# Altium schematic sheet PWR RAIL.SchDoc: ESP32 - ANALOG BOARD
size A3; DrawnBy: Luca Schenetti; Engineer: Luca Schenetti; Revision: B; SheetNumber: 6; SheetTotal: 5
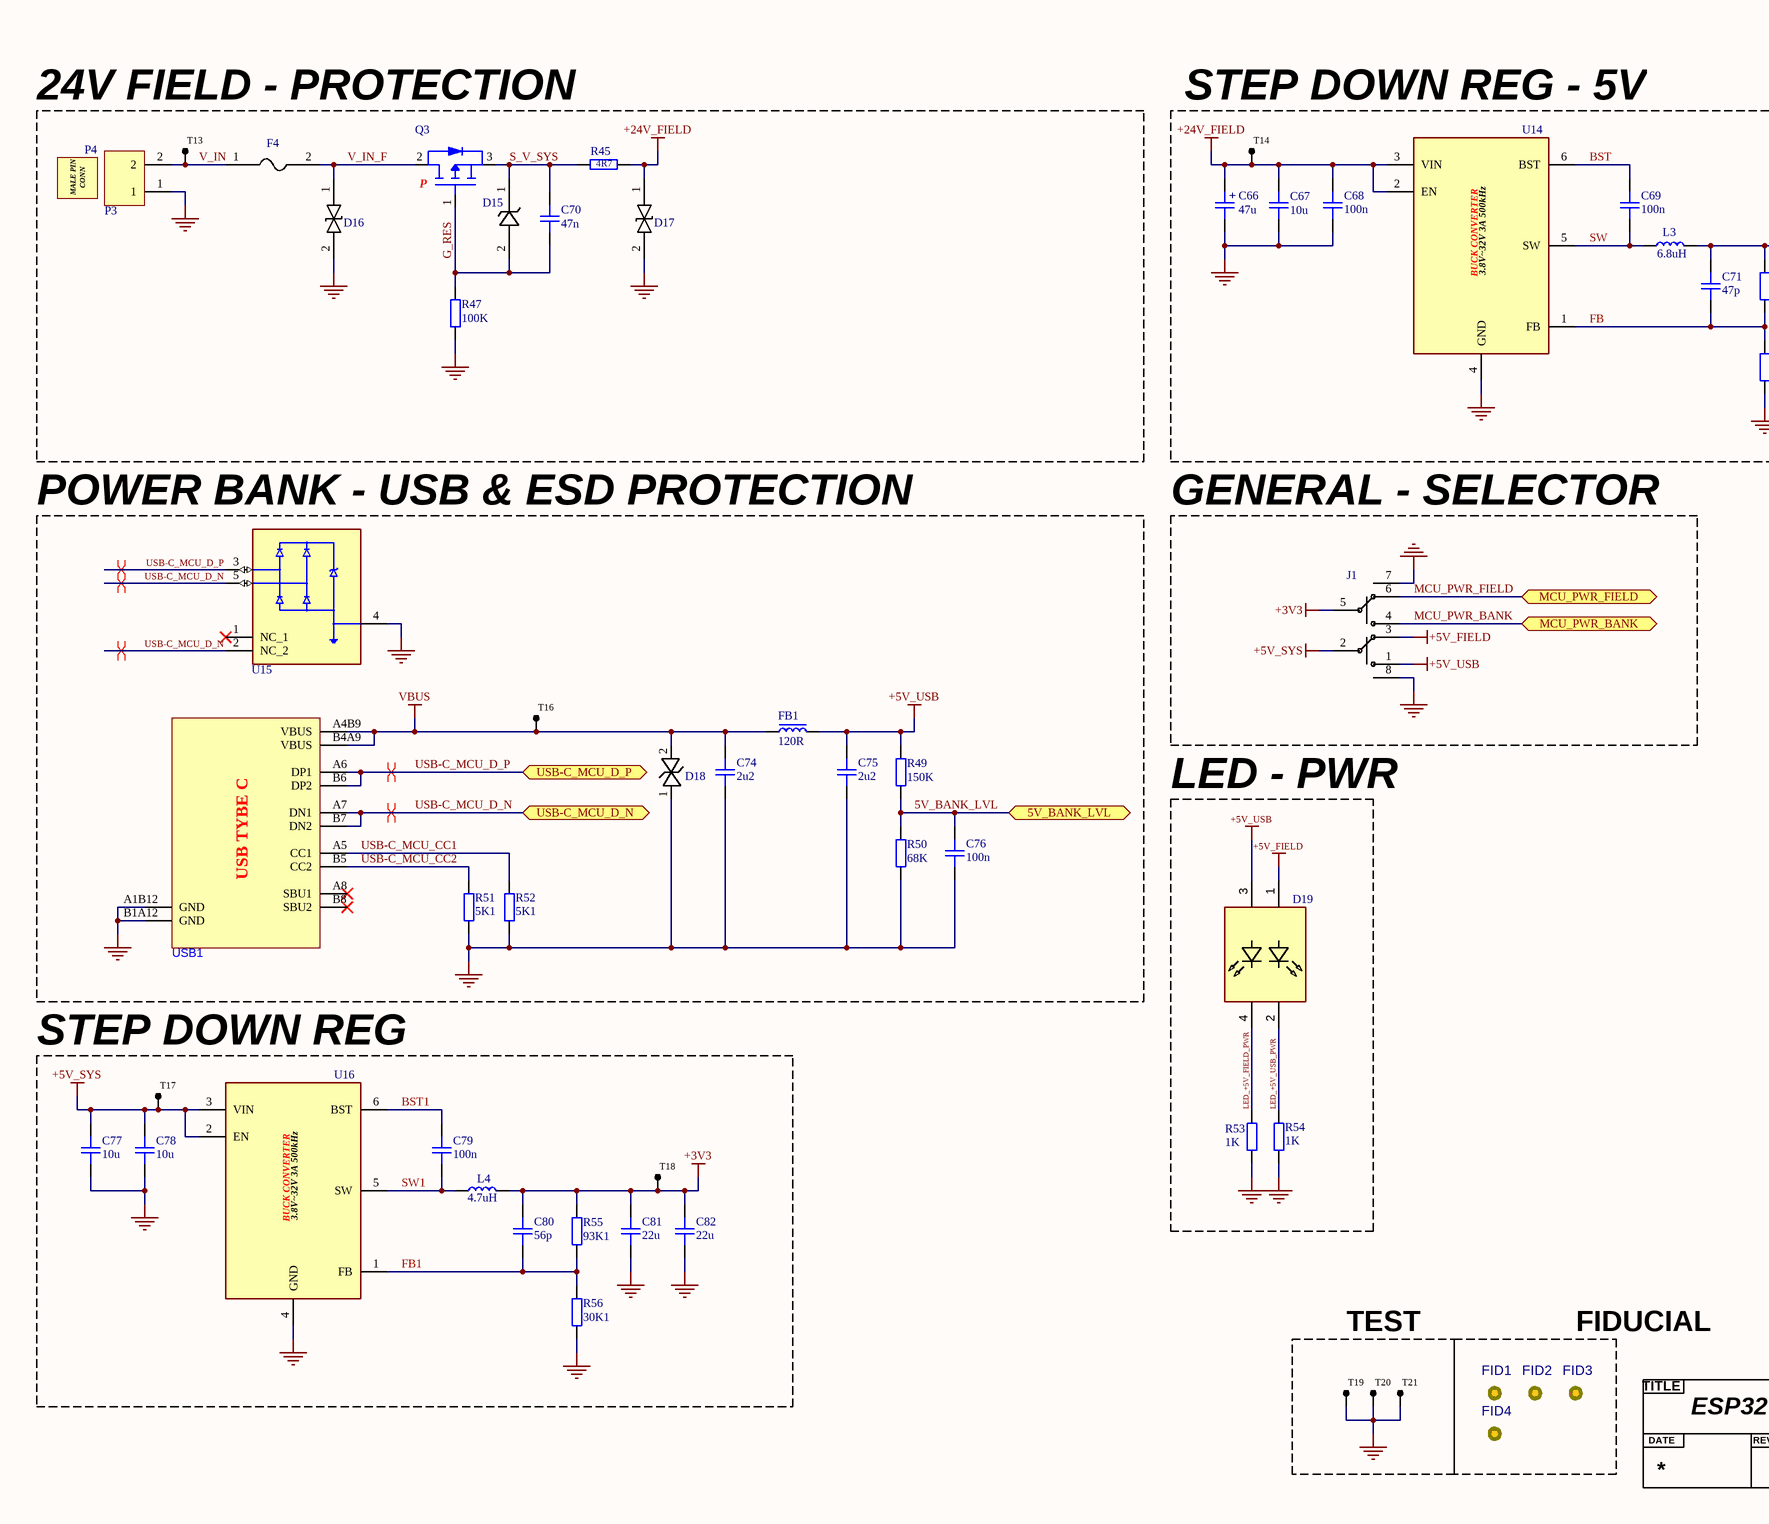
[diagram p0: PWR RAIL.SchDoc, left]
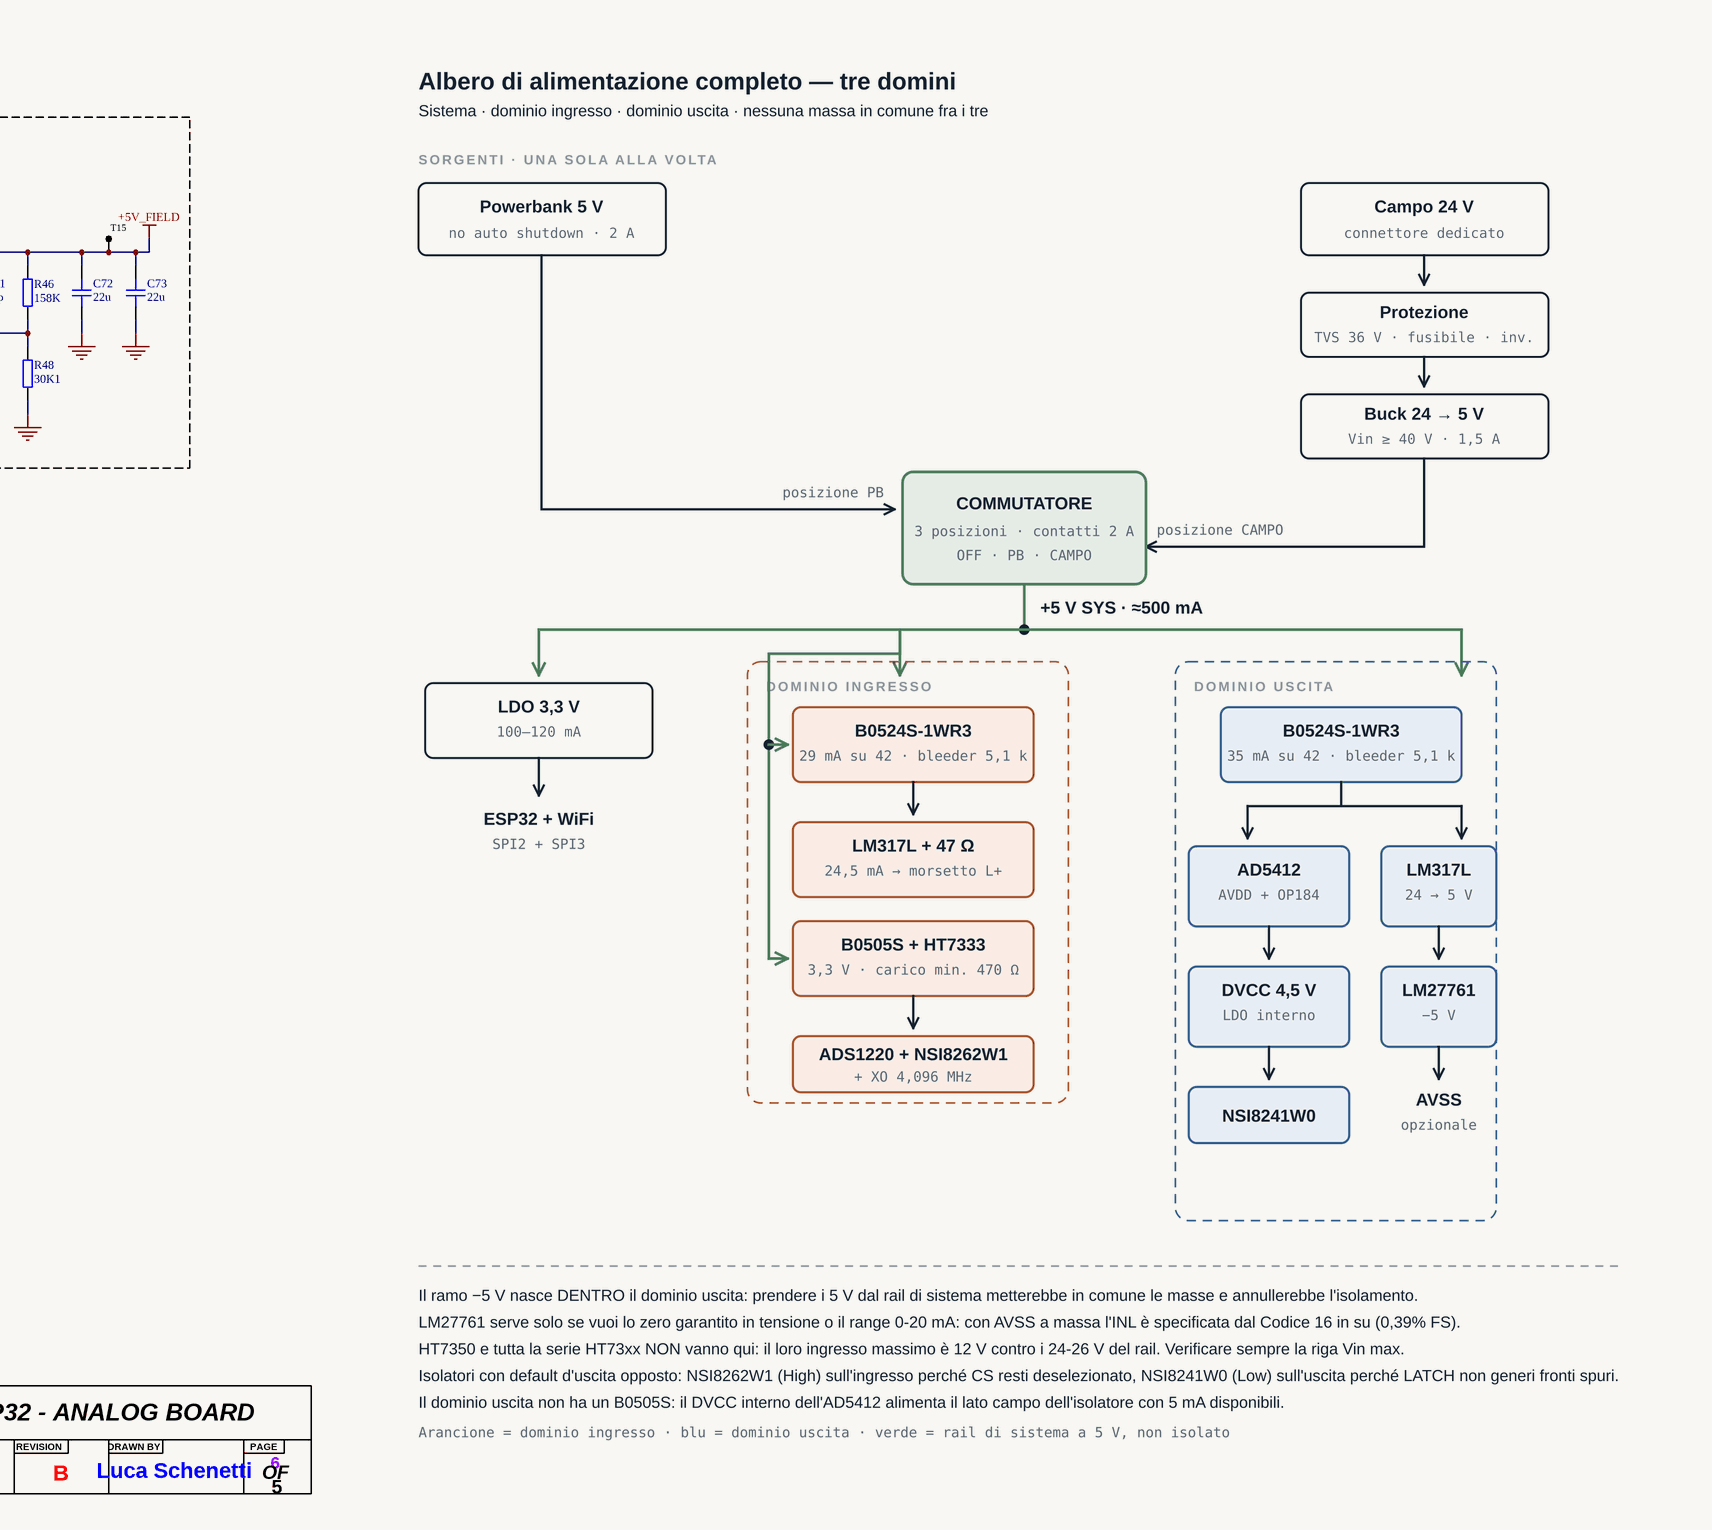
[diagram p1: PWR RAIL.SchDoc, right]

## Parts
?  Title  (value not drawn)  (graphical)
C66  47u  [CAP_ALEL_6.3x5.4]
C67  10u  [CAP_0805]
C68  100n  [CAP_0603]
C69  100n  [CAP_0603]
C70  47n  [CAP_0603]
C71  47p  [CAP_0603]
C72  22u  [CAP_0603]
C73  22u  [CAP_0603]
C74  2u2  [CAP_0402]
C75  2u2  [CAP_0402]
C76  100n  [CAP_0402]
C77  10u  [CAP_0603]
C78  10u  [CAP_0603]
C79  100n  [CAP_0603]
C80  56p  [CAP_0603]
C81  22u  [CAP_0603]
C82  22u  [CAP_0603]
D15  ZENER DIODE 15V  [BZT52C15]  (value not drawn)
D16  BIDI TVS 30V  [SMAJ30CA]  (value not drawn)
D17  BIDI TVS 30V  [SMAJ30CA]  (value not drawn)
D18  ESD Protection TVS 6.0V  [SMF6.0CA]  (value not drawn)
D19  TWO LED GREEN  [TJ-L3F2LTQYKMQFLC7K-A5]  (value not drawn)
F4  PTC 60V 500mA  [mSMD050-60V]  (value not drawn)
FB1  120R  [FB_0402]
FID1  FIDUCIAL  [FIDUCIAL]  (value not drawn)  (no BOM)
FID2  FIDUCIAL  [FIDUCIAL]  (value not drawn)  (no BOM)
FID3  FIDUCIAL  [FIDUCIAL]  (value not drawn)  (no BOM)
FID4  FIDUCIAL  [FIDUCIAL]  (value not drawn)  (no BOM)
J1  DPDT  [2MD3T2B1M6RES]  (value not drawn)
L3  6.8uH  [FXL0530-6R8-M]
L4  4.7uH  [IND-SMD_L4.4-W4.2]
P3  2P PLUGGABLE TERMINAL BLOCK 3.81MM  [WJ15EDGRC-3.81-2P]  (value not drawn)
P4  MALE CONN 2P 3.81mm  [WJ15EDGK-3.81-2P]  (value not drawn)
Q3  P-Mosfet 60V 3A  [BSP315P]  (value not drawn)
R45  4R7  [RES_2512]
R46  158K  [RES_0603]
R47  100K  [RES_0603]
R48  30K1  [RES_0603]
R49  150K  [RES_0402]
R50  68K  [RES_0402]
R51  5K1  [RES_0402]
R52  5K1  [RES_0402]
R53  1K  [RES_0402]
R54  1K  [RES_0402]
R55  93K1  [RES_0603]
R56  30K1  [RES_0603]
T13  TP_S  [TP 1mm]  (value not drawn)  (no BOM)
T14  TP_S  [TP 1mm]  (value not drawn)  (no BOM)
T15  TP_S  [TP 1mm]  (value not drawn)  (no BOM)
T16  TP_S  [TP 1mm]  (value not drawn)  (no BOM)
T17  TP_S  [TP 1mm]  (value not drawn)  (no BOM)
T18  TP_S  [TP 1mm]  (value not drawn)  (no BOM)
T19  TP_S  [TP 1mm]  (value not drawn)  (no BOM)
T20  TP_S  [TP 1mm]  (value not drawn)  (no BOM)
T21  TP_S  [TP 1mm]  (value not drawn)  (no BOM)
U14  3.8V~32V 3A 500kHz  [AP63301WU-7]  (value not drawn)
U15  TVS USB 2.0 ±25-kV  [TPD2E2U06DRLR]  (value not drawn)
U16  3.8V~32V 3A 500kHz  [AP63301WU-7]  (value not drawn)
USB1  USB-C CONNECTOR 16P VERTICAL  [TYPEC-305-ACP16H458]  (value not drawn)

## Blocks framed on the sheet
24V FIELD - PROTECTION: C70 D15-D17 F4 P3 P4 Q3 R45 R47 T13
STEP DOWN REG - 5V: C66-C69 C71-C73 L3 R46 R48 T14 T15 U14
POWER BANK - USB & ESD PROTECTION: C74-C76 D18 FB1 R49-R52 T16 U15 USB1
GENERAL - SELECTOR: J1
LED - PWR: D19 R53 R54
STEP DOWN REG: C77-C82 L4 R55 R56 T17 T18 U16
TEST: T19-T21
FIDUCIAL: FID1-FID4

## Ports
5V_BANK_LVL (bidir, see MCU[3B]), MCU_PWR_BANK (bidir, see MCU[3B]), MCU_PWR_FIELD (bidir, see MCU[3B]), USB-C_MCU_D_N (bidir, see MCU[3B]), USB-C_MCU_D_P (bidir, see MCU[3B])

## Nets
+3V3: C80.2 C81.2 C82.2 J1.5 L4.2 R55.2 T18.1
+5V_FIELD: C71.2 C72.2 C73.2 D19.1(A1) J1.3 L3.2 R46.2 T15.1
+5V_SYS: C77.2 C78.2 J1.2 T17.1 U16.2(EN) U16.3(VIN)
+5V_USB: C75.2 D19.3(B1) FB1.2 J1.1 R49.2
+24V_FIELD: C66.1 C67.2 C68.2 D17.1 R45.2 T14.1 U14.2(EN) U14.3(VIN)
GND: C66.2 C67.1 C68.1 C72.1 C73.1 C74.1 C75.1 C76.1 C77.1 C78.1 C81.1 C82.1 D16.2 D17.2 D18.1 J1.7 J1.8 P3.1 R47.1 R48.1 R50.1 R51.1 R52.1 R53.1 R54.1 R56.1 T19.1 T20.1 T21.1 U14.4(GND) U15.4(GND) U16.4(GND) USB1.A1B12(GND) USB1.B1A12(GND)
VBUS: C74.2 D18.2 FB1.1 T16.1 USB1.A4B9(VBUS) USB1.B4A9(VBUS)
5V_BANK_LVL: C76.2 R49.1 R50.2 ; port 5V_BANK_LVL
BST: C69.2 U14.6(BST)
BST1: C79.2 U16.6(BST)
FB: C71.1 R46.1 R48.2 U14.1(FB)
FB1: C80.1 R55.1 R56.2 U16.1(FB)
G_RES: C70.1 D15.2(A) Q3.1(G) R47.2
LED_+5V_FIELD_PWR: D19.4(B2) R53.2
LED_+5V_USB_PWR: D19.2(A2) R54.2
MCU_PWR_BANK: J1.4 ; port MCU_PWR_BANK
MCU_PWR_FIELD: J1.6 ; port MCU_PWR_FIELD
S_V_SYS: C70.2 D15.1(K) Q3.3(S) R45.1
SW: C69.1 L3.1 U14.5(SW)
SW1: C79.1 L4.1 U16.5(SW)
USB-C_MCU_CC1: R52.2 USB1.A5(CC1)
USB-C_MCU_CC2: R51.2 USB1.B5(CC2)
USB-C_MCU_D_N: U15.2(NC_2) U15.5(IO2) USB1.A7(DN1) USB1.B7(DN2) ; port USB-C_MCU_D_N
USB-C_MCU_D_P: U15.3(IO1) USB1.A6(DP1) USB1.B6(DP2) ; port USB-C_MCU_D_P
V_IN: F4.1 P3.2 T13.1
V_IN_F: D16.1 F4.2 Q3.2(D)

Not connected (* = marked no-connect by the designer): U15 1(NC_1)*; USB1 A8(SBU1)* B8(SBU2)*

## Layout directives
differential pair; differential pair class DIFF_USB_90Ω: USB-C_MCU_D_N, USB-C_MCU_D_P

## Notes on the sheet
- (in symbol AP63301WU-7) BUCK CONVERTER
- (in symbol BSP315P) P
- (in symbol CAP_ALEL_6.3x5.4) +
- (in symbol Title) TITLE; DATE; REVISION; DRAWN BY; PAGE; OF
- (in symbol TYPEC-305-ACP16H458) USB TYBE C
- (in symbol WJ15EDGK-3.81-2P) MALE PIN; CONN

## Library data of the parts
C66 = CAP_ALEL_6.3x5.4: [C48971023]; Manufacturer: *; Manufacturer Part Number: *; Distributor Link: *; LCSC: *
C67 = CAP_0805: [C440198]; Manufacturer: *; Manufacturer Part Number: *; Distributor Link: *; LCSC: *; Rating: *; Dielectric: *
C68 C69 C79 = CAP_0603: [C14663]; Manufacturer: *; Manufacturer Part Number: *; Distributor Link: *; LCSC: *; Rating: *; Dielectric: *
C70 = CAP_0603: [C1622]; Manufacturer: *; Manufacturer Part Number: *; Distributor Link: *; LCSC: *; Rating: *; Dielectric: *
C71 = CAP_0603: [C1671]; Manufacturer: *; Manufacturer Part Number: *; Distributor Link: *; LCSC: *; Rating: *; Dielectric: *
C72 C73 C81 C82 = CAP_0603: [C59461]; Manufacturer: *; Manufacturer Part Number: *; Distributor Link: *; LCSC: *; Rating: *; Dielectric: *
C74 C75 = CAP_0402: [C12530]; Manufacturer: *; Manufacturer Part Number: *; Distributor Link: *; LCSC: *; Rating: *; Dielectric: *
C76 = CAP_0402: [C307331]; Manufacturer: *; Manufacturer Part Number: *; Distributor Link: *; LCSC: *; Rating: *; Dielectric: *
C77 C78 = CAP_0603: [C194427]; Manufacturer: *; Manufacturer Part Number: *; Distributor Link: *; LCSC: *; Rating: *; Dielectric: *
C80 = CAP_0603: [C39148]; Manufacturer: *; Manufacturer Part Number: *; Distributor Link: *; LCSC: *; Rating: *; Dielectric: *
D15 = BZT52C15: [C19077412]
D16 D17 = SMAJ30CA: [C10755]
D18 = SMF6.0CA: [C123791]
D19 = TJ-L3F2LTQYKMQFLC7K-A5: [C20613347]
F4 = mSMD050-60V: [C70113]
FB1 = FB_0402: [C76891]; Manufacturer: *; Manufacturer Part Number: *; Distributor Link: *; LCSC: *
J1 = 2MD3T2B1M6RES: [C545196]
L3 = FXL0530-6R8-M: [C177249]
L4 = IND-SMD_L4.4-W4.2: [C5349668]
P3 = WJ15EDGRC-3.81-2P: [C8387]
P4 = WJ15EDGK-3.81-2P: [C8466]
Q3 = BSP315P: [C5246415]
R45 = RES_2512: [C25489]
R46 = RES_0603: [C22883]; Manufacturer: *; Manufacturer Part Number: *; Distributor Link: *; LCSC: *
R47 = RES_0603: [C25803]; Manufacturer: *; Manufacturer Part Number: *; Distributor Link: *; LCSC: *
R48 R56 = RES_0603: [C137745]; Manufacturer: *; Manufacturer Part Number: *; Distributor Link: *; LCSC: *
R49 = RES_0402: [C93947]; Manufacturer: *; Manufacturer Part Number: *; Distributor Link: *; LCSC: *
R50 = RES_0402: [C2909379]; Manufacturer: *; Manufacturer Part Number: *; Distributor Link: *; LCSC: *
R51 R52 = RES_0402: [C25905]; Manufacturer: *; Manufacturer Part Number: *; Distributor Link: *; LCSC: *
R53 R54 = RES_0402: [C11702]; Manufacturer: *; Manufacturer Part Number: *; Distributor Link: *; LCSC: *
R55 = RES_0603: [C23266]; Manufacturer: *; Manufacturer Part Number: *; Distributor Link: *; LCSC: *
T13-T21 = TP_S: test point
U14 U16 = AP63301WU-7: [C2158003]
U15 = TPD2E2U06DRLR: [C1972959]
USB1 = TYPEC-305-ACP16H458: [C5454943]; Manufacturer: XKB Connectivity(中国星坤); Symbol: U262-16XN-4BVC11; Device: U262-161N-4BVC11; Add into BOM: yes; Connector Type: Type-C; Gender: Female; Number of Ports: 1; Current Rating - Power (Max): 3A; Soldering Temperature(Max): 260℃; LCSC Part Name: Type-C 母 卧贴; Supplier Part: C319148; Manufacturer Part: U262-161N-4BVC11; Supplier Footprint: SMD; JLCPCB Part Class: Extended Part; Datasheet: https://atta.szlcsc.com/upload/public/pdf/source/20211015/B478CBA0F1623DA36A6CC6918C49C838.pdf; Supplier: LCSC; Convert to PCB: yes; Standard: USB 3.1; Number of Contacts: 16P; Mounting Style: 卧贴; Contact Material: Copper Alloy; Contact Plating: Gold; Operating Temperature Range: -40℃~+85℃
FID1-FID4 = FIDUCIAL: Revision: 0; Description_: FIDUCIAL; DNP: DNP